# Altium project BTN Motor.PrjPCB
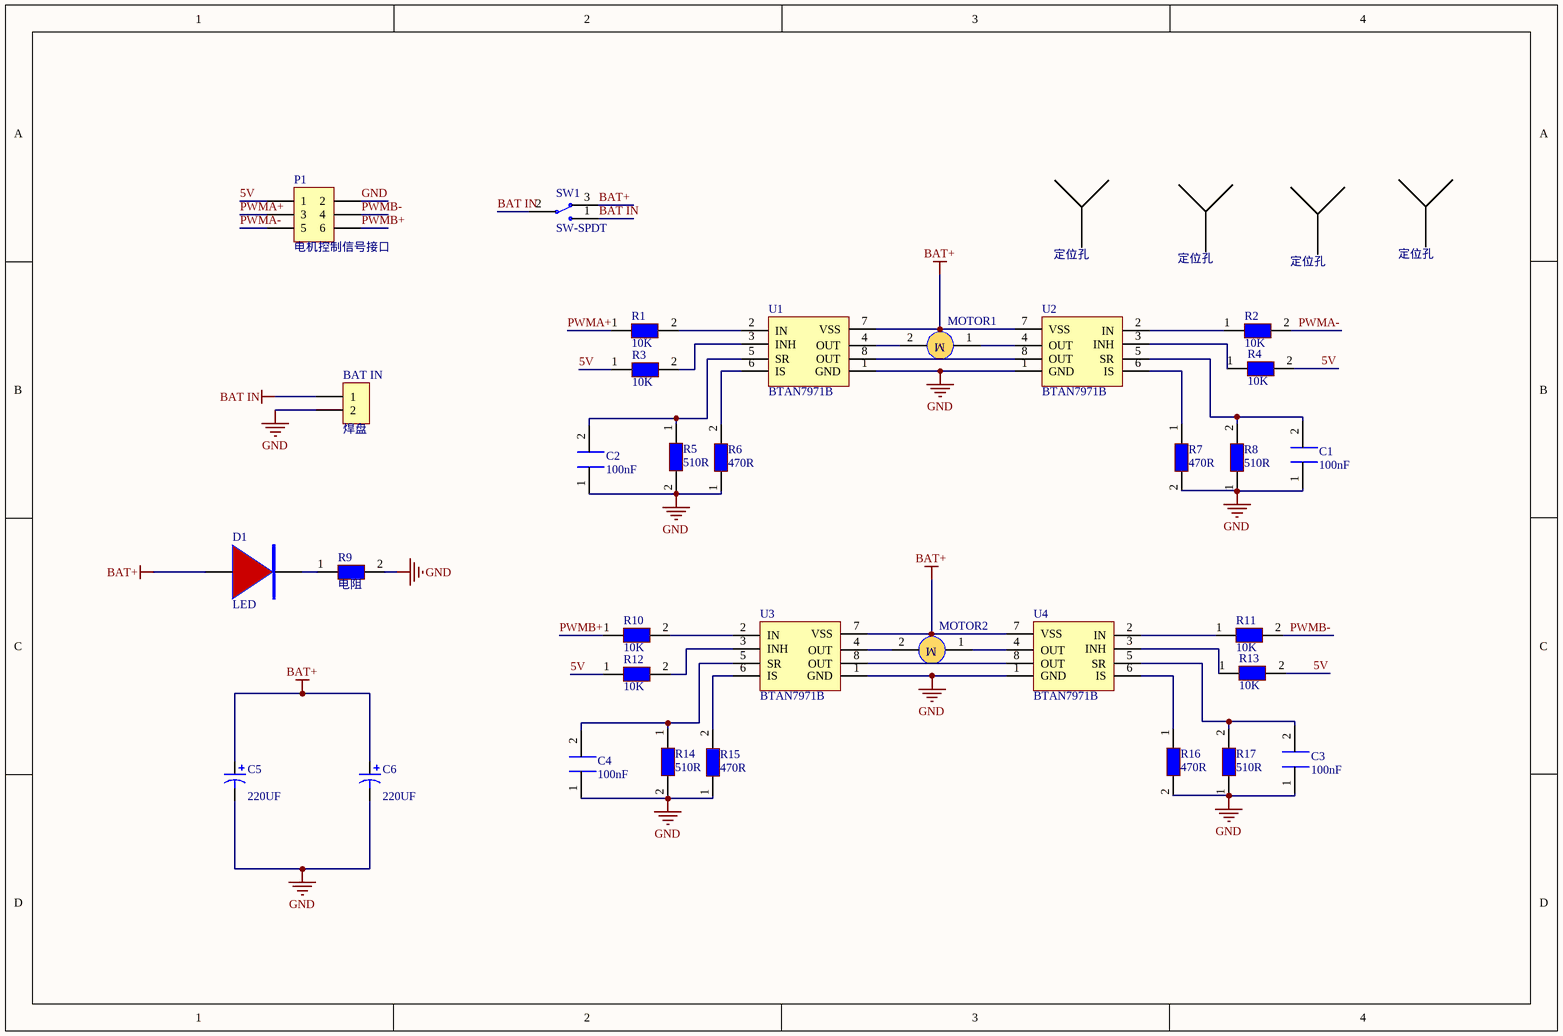
[diagram p0: BTN Motor.SchDoc]
1 sheet, 37 parts. Net scope: global (net labels, ports and power ports of the same name join across sheets).
Board file: BTN Motor.PcbDoc

## Sheet BTN Motor.SchDoc
size A4

### Parts
*1  定位孔  [M3x7 铜柱+星孔]
*2  定位孔  [M3x7 铜柱+星孔]
*3  定位孔  [M3x7 铜柱+星孔]
*4  定位孔  [M3x7 铜柱+星孔]
BAT_IN  焊盘  [5.08 2P 螺钉端子]
C1  100nF  [C0601]
C2  100nF  [C0601]
C3  100nF  [C0601]
C4  100nF  [C0601]
C5  value 220UF  [CAP 2.5*6.3*7 - BK]  (hidden comment: Cap Pol1)
C6  value 220UF  [CAP 2.5*6.3*7 - BK]  (hidden comment: Cap Pol1)
D1  LED  [0603 LED B]
MOTOR1  MOTOR1  [5.08 2P 螺钉端子]  (value not drawn)
MOTOR2  MOTOR1  [5.08 2P 螺钉端子]  (value not drawn)
P1  电机控制信号接口  [MX 1.25-WS-6P]
R1  10K  [R0603]
R2  10K  [R0603]
R3  10K  [R0603]
R4  10K  [R0603]
R5  510R  [R0603]
R6  470R  [R0603]
R7  470R  [R0603]
R8  510R  [R0603]
R9  电阻  [R0603]
R10  10K  [R0603]
R11  10K  [R0603]
R12  10K  [R0603]
R13  10K  [R0603]
R14  510R  [R0603]
R15  470R  [R0603]
R16  470R  [R0603]
R17  510R  [R0603]
SW1  SW-SPDT  [小船开关]
U1  BTAN7971B  [TO263-7A]
U2  BTAN7971B  [TO263-7A]
U3  BTAN7971B  [TO263-7A]
U4  BTAN7971B  [TO263-7A]

### Nets
BAT IN: BAT_IN.1 SW1.1 SW1.2
BAT+: C5.1 C6.1 D1.1 SW1.3 U1.7(VSS) U2.7(VSS) U3.7(VSS) U4.7(VSS)
GND: BAT_IN.2 C1.1 C2.1 C3.1 C4.1 C5.2 C6.2 P1.2 R5.2 R6.1 R7.2 R8.1 R9.2 R14.2 R15.1 R16.2 R17.1 U1.1(GND) U2.1(GND) U3.1(GND) U4.1(GND)
5V: P1.1 R3.1 R4.2 R12.1 R13.2
PWMA+: P1.3 R1.1
PWMA-: P1.5 R2.2
PWMB+: P1.6 R10.1
PWMB-: P1.4 R11.2
NetC1_2: C1.2 R8.2 U2.5(SR)
NetC2_2: C2.2 R5.1 U1.5(SR)
NetC3_2: C3.2 R17.2 U4.5(SR)
NetC4_2: C4.2 R14.1 U3.5(SR)
NetD1_2: D1.2 R9.1
NetMOTOR1_1: MOTOR1.1 U2.4(OUT)
NetMOTOR1_2: MOTOR1.2 U1.4(OUT)
NetMOTOR2_1: MOTOR2.1 U4.4(OUT)
NetMOTOR2_2: MOTOR2.2 U3.4(OUT)
NetR1_2: R1.2 U1.2(IN)
NetR2_1: R2.1 U2.2(IN)
NetR3_2: R3.2 U1.3(INH)
NetR4_1: R4.1 U2.3(INH)
NetR6_2: R6.2 U1.6(IS)
NetR7_1: R7.1 U2.6(IS)
NetR10_2: R10.2 U3.2(IN)
NetR11_1: R11.1 U4.2(IN)
NetR12_2: R12.2 U3.3(INH)
NetR13_1: R13.1 U4.3(INH)
NetR15_2: R15.2 U3.6(IS)
NetR16_1: R16.1 U4.6(IS)
NetU1_8: U1.8(OUT) U2.8(OUT)
NetU3_8: U3.8(OUT) U4.8(OUT)

### Notes on the sheet
- (in symbol MOTOR1) M

### Library data of the parts
C1-C4 = 电容
C5 C6 = Cap Pol1: Polarized Capacitor (Radial); Published: 8-Jun-2000; LatestRevisionDate: 17-Jul-2002; LatestRevisionNote: Re-released for DXP Platform.; PackageReference: RB7.6-15; Publisher: Altium Limited; PackageDescription: Polarized Capacitor (Radial); 2 Leads
R1-R8 R10-R17 = 电阻
SW1 = 开关